# Altium schematic sheet Input_Power.SchDoc
size A; Author: Jared Ainsworth; CompanyName: UpRev LLC; Engineer: Jared Ainsworth; Organization: UpRev LLC; Address1: 4807 Commercial Park Dr.; Address2: Austin, TX 78724; Address3: United States; Address4: www.UpRev.com; SheetNumber: 10; SheetTotal: 13
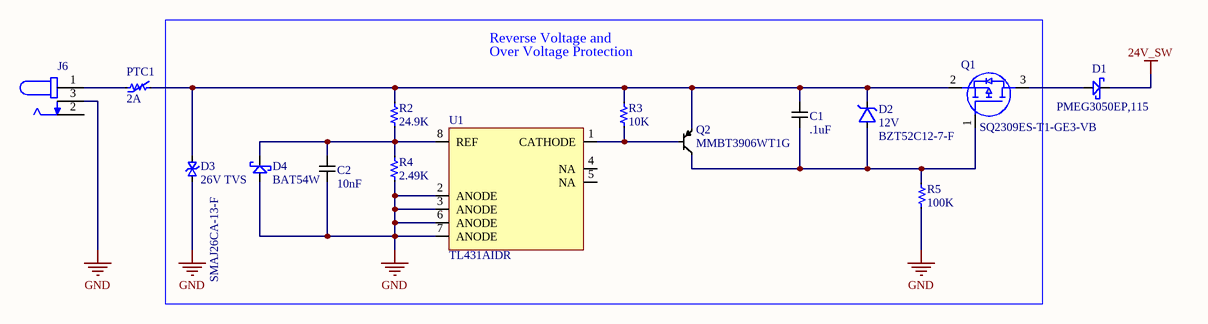
[diagram p0: Input_Power.SchDoc]

## Parts
C1  .1uF  [C0603 (1608)]
C2  10nF  [C0805 (2012)]
D1  PMEG3050EP,115  [SOD-128]
D2  Zener Voltage: 12V  [SOD-123 Diode]  (hidden comment: BZT52C12-7-F)
D3  26V TVS  [Diodes_SMA_0]
D4  BAT54W  [Diode SOD-123]
J6  PJ-002A  [Connector PJ-002A]  (value not drawn)
PTC1  2A  [R1210 (3225)]
Q1  SQ2309ES-T1-GE3-VB  [SOT-23-3]
Q2  Manufacturer Part Number: MMBT3906WT1G  [SC70 (SOT-323)]  (hidden comment: MMBT3906)
R2  24.9K  [R0603 (1608)]
R3  10K  [R0402 (1005)]
R4  2.49K  [R0603 (1608)]
R5  100K  [R0603 (1608)]
U1  TL431AIDR  [SOIC-8]

## Nets
24V_SW: D1.1(Cathode)
GND: C2.2 D3.1 D4.2(Anode) J6.3 R4.1 R5.2 U1.2(ANODE) U1.3(ANODE) U1.6(ANODE) U1.7(ANODE)
NetC1_1: C1.1 D2.1(Cathode) D3.2 PTC1.2 Q1.2(S) Q2.2(E) R2.2 R3.2
NetC1_2: C1.2 D2.2(Anode) Q1.1(G) Q2.3(C) R5.1
NetC2_1: C2.1 D4.1(Cathode) R2.1 R4.2 U1.8(REF)
NetD1_2: D1.2(Anode) Q1.3(D)
NetJ6_1: J6.1 PTC1.1
NetQ2_1: Q2.1(B) R3.1 U1.1(CATHODE)

Not connected (* = marked no-connect by the designer): J6 2; U1 4(NA) 5(NA)

## Notes on the sheet
- (near R3) Over Voltage Protection
- Reverse Voltage and
- Title
- Size:
- Engineer:
- A
- Number:
- Revision:
- Sheet
- of
- File:

## Library data of the parts
C1 = 100nF Ceramic, 25V, 0603 (1608): 100nF Ceramic Capacitor, 25V, X7R, ±10%, 0603 (1608); Manufacturer Part Number: CL10B104KA8NNNC; Manufacturer: Samsung Electro-Mechanics; Package: 0603 (1608 metric); LCSC Part Number: C1590; Value: .1uF
C2 = 10nF Ceramic, 50V, 0805 (2012): 10nF Ceramic Capacitor, 50V, ±10%, 0805 (2012); Manufacturer Part Number: CL21B103KBANNNC; Manufacturer: Samsung Electro-Mechanics; Package: 0805 (2012 metric); Value: 10nF; LCSC Part Number: C1710; Footprint: 0805
D1 = PMEG3050EP,115: Schottky Diode, 5A, 30V, SOD-128; Manufacturer: Nexperia; Package: SOD-128; LCSC Part Number: C50603; Manufacturer Part Number: PMEG3050EP,115
D2 = BZT52C12-7-F: Zener Diode, 12V, 500mW, Surface Mount SOD-123; Manufacturer: Diodes Incorporated; LCSC Part Number: C124196; Package: SOD-123; Manufacturer Part Number: BZT52C12-7-F
D3 = SMAJ26CA-13-F: 26V TVS Diode 9.5A Bidirectional Surface Mount DO-214AC; Manufacturer: Diodes Incorporated; Package: SMA; LCSC Part Number: C134976; Value: 26V TVS; Manufacturer Part Number: SMAJ26CA-13-F
D4 = BAT54W: Schottky Diode, 600mA, 30V, SOD-123; Manufacturer: Yangzhou Yangjie Elec Tech; Package: SOD-123; LCSC Part Number: C699107; Footprint: SOD-123; Manufacturer Part Number: BAT54W
J6 = PJ-002A: Barrel Connector Socket 5.5x2mm; Manufacturer: CUI; Mating Connector: 1757022; Part Number: PJ-002A; Manufacturer Part Number: PJ-002A; LCSC Part Number: C3096082; Package: Plugin,P=5.08mm
PTC1 = SMD1210P200TF: 2A Resettable Fuse, 1210; Manufacturer: RUILON(Shenzhen Ruilongyuan Elec); Package: 1210; Manufacturer Part Number: SMD1210P200TF; LCSC Part Number: C20808; Value: 2A
Q1 = SQ2309ES-T1-GE3-VB: MOSFET P-Channel, 60V, VBsemi Elec SQ2309ES-T1-GE3-VB; Manufacturer: VBsemi Elec; Manufacturer Part Number: SQ2309ES-T1-GE3-VB; LCSC Part Number: C6705325; Package: SOT-23(TO-236)
Q2 = PNP BiPolar Transistor (BJT), 40V, MMBT3906WT1G: PNP Bipolar Transistor (BJT), 200mA, 40V, SOT-323-3, ON Semi MMBT3906WT1G; Manufacturer: ON Semiconductor; LCSC Part Number: C150043; Package: SOT-323-3
R2 = 24.9K ohm, 0603 (1608): 24.9K ohm, Resistor, ±1%, 0603 (1608); Manufacturer: UNI-ROYAL(Uniroyal Elec); Manufacturer Part Number: 0603WAF2492T5E; Package: 0603 (1608 metric); LCSC Part Number: C25962; Value: 24.9K
R3 = 10K ohm, 0402 (1005): 10K ohm, Resistor, ±1%, 0402 (1005); Manufacturer: Ever Ohms Tech; Manufacturer Part Number: CR0402F10K0Q10Z; Power: 100mW; Package: 0402 (1005 metric); LCSC Part Number: C881209; Value: 10K
R4 = 2.49K ohm, 0603 (1608): 2.49K ohm, Resistor, ±1%, 0603 (1608); Manufacturer: UNI-ROYAL(Uniroyal Elec); Manufacturer Part Number: 0603WAF2491T5E; Package: 0603 (1608 metric); LCSC Part Number: C22908; Value: 2.49K
R5 = 100K ohm, 0603 (1608): 100K ohm, Resistor, ±1%, 0603 (1608); Manufacturer: YAGEO; Manufacturer Part Number: RC0603FR-07100KL; Package: 0603 (1608 metric); LCSC Part Number: C14675; Value: 100K
U1 = TL431AIDR: Shunt Voltage Reference IC Adjustable 2.495V 36 VV ±1; Manufacturer: Texas Instruments; LCSC Part Number: C6970; Package: SOIC-8; Manufacturer Part Number: TL431AIDR